# EAGLE schematic Full System (EAGLE 9.6.2)
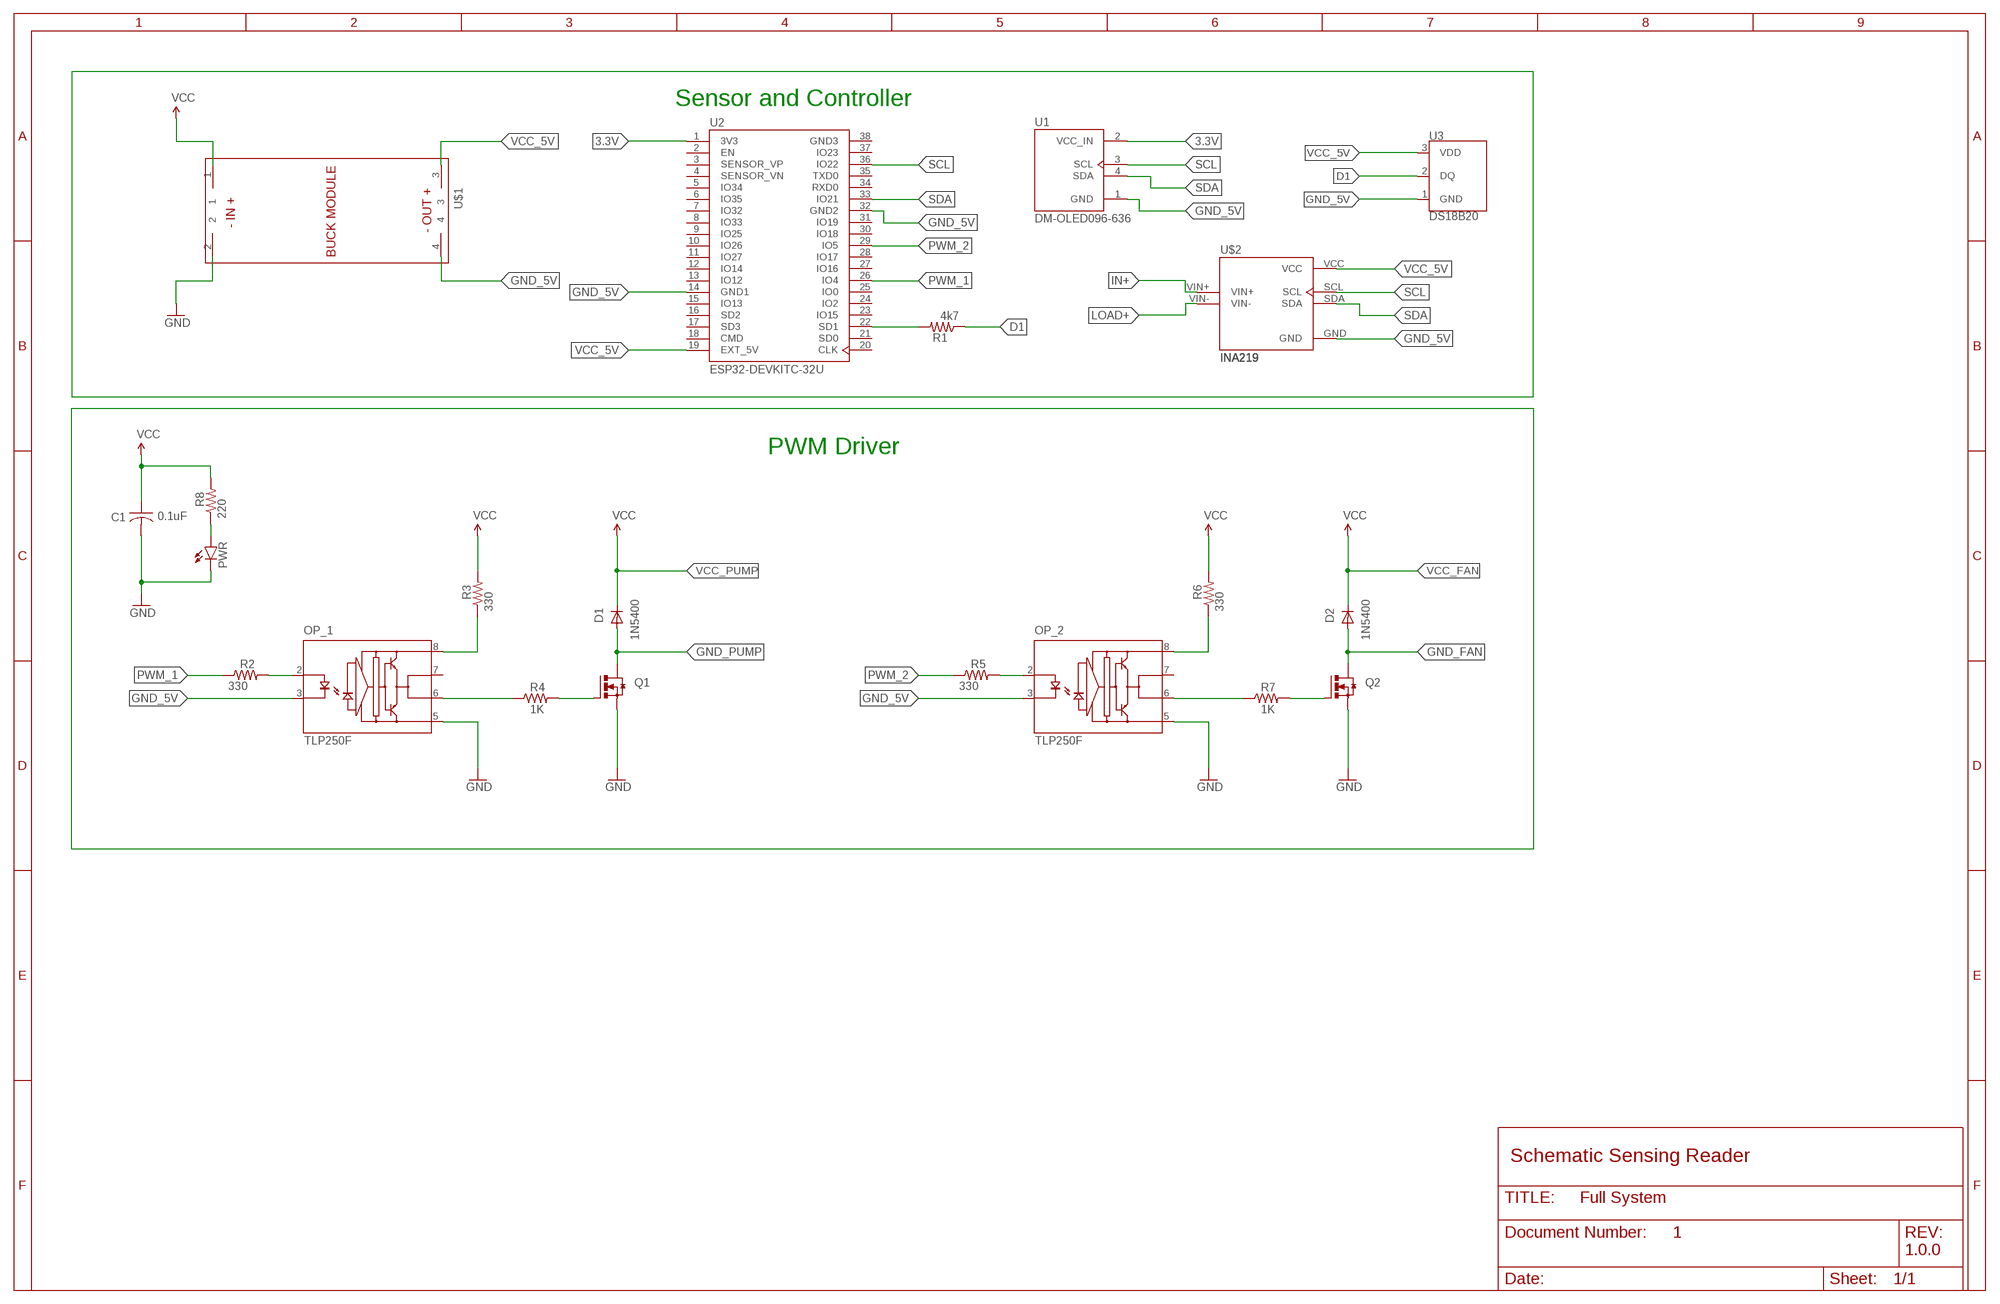
[diagram p0: schematic, sheet 1]
FRAME1 (FRAME_B_L): DESIGNER: PRATIK MAKWANA; DOC: 1; REV: 1.0.0

## Parts
C1  0.1uF  C-US050-030X075  [C050-030X075]
D1  1N5400  [DO201-15]
D2  1N5400  [DO201-15]
OP_1  TLP250F  [DIL08]
OP_2  TLP250F  [DIL08]
PWR  LED5MM  [LED5MM]
Q1  IRFP240  [TO247BV]
Q2  IRFP240  [TO247BV]
R1  4k7  R-US_0207/10  [0207/10]
R2  330  R-US_0207/10  [0207/10]
R3  330  R-US_0411/15  [0411/15]
R4  1K  R-US_0411/15  [0411/15]
R5  330  R-US_0207/10  [0207/10]
R6  330  R-US_0411/15  [0411/15]
R7  1K  R-US_0411/15  [0411/15]
R8  220  R-US_0207/10  [0207/10]
U1  DM-OLED096-636  [MODULE_DM-OLED096-636]
U2  ESP32-DEVKITC-32U  [MODULE_ESP32-DEVKITC-32U]
U3  DS18B20  [TO-92-AMMO]
U$1  BUCK_MODULEWITH_SMDPADS&THROUGHHOLES  [BUCK_MODULE]
U$2  INA219  [INA219]

## Nets
3.3V: U1.2(VCC_IN) U2.1(3V3)
D1: R1.1 U3.2(DQ)
GND: C1.2 OP_1.5(GND) OP_2.5(GND) PWR.K(C) Q1.S Q2.S U$1.2
GND_5V: OP_1.3(K) OP_2.3(K) U1.1(GND) U2.14(GND1) U2.32(GND2) U3.1(GND) U$1.4 U$2.GND
GND_FAN: D2.A Q2.D
GND_PUMP: D1.A Q1.D
IN+: U$2.VIN+
LOAD+: U$2.VIN-
N$1: R1.2 U2.22(SD1)
N$2: OP_1.2(A) R2.2
N$3: OP_2.2(A) R5.2
N$4: OP_1.6(VO) R4.1
N$5: Q1.G R4.2
N$6: OP_2.6(VO) R7.1
N$7: OP_1.8(VCC) R3.1
N$8: Q2.G R7.2
N$9: OP_2.8(VCC) R6.1
N$10: PWR.A R8.1
PWM_1: R2.1 U2.26(IO4)
PWM_2: R5.1 U2.29(IO5)
SCL: U1.3(SCL) U2.36(IO22) U$2.SCL
SDA: U1.4(SDA) U2.33(IO21) U$2.SDA
VCC: C1.1 R3.2 R8.2 U$1.1
VCC_5V: R6.2 U2.19(EXT_5V) U3.3(VDD) U$1.3 U$2.VCC ; supply symbol labelled VCC
VCC_FAN: D2.C ; supply symbol labelled VCC
VCC_PUMP: D1.C ; supply symbol labelled VCC
Unconnected: OP_1.7(VO') OP_2.7(VO') U2.2(EN) U2.3(SENSOR_VP) U2.4(SENSOR_VN) U2.5(IO34) U2.6(IO35) U2.7(IO32) U2.8(IO33) U2.9(IO25) U2.10(IO26) U2.11(IO27) U2.12(IO14) U2.13(IO12) U2.15(IO13) U2.16(SD2) U2.17(SD3) U2.18(CMD) U2.20(CLK) U2.21(SD0) U2.23(IO15) U2.24(IO2) U2.25(IO0) U2.27(IO16) U2.28(IO17) U2.30(IO18) U2.31(IO19) U2.34(RXD0) U2.35(TXD0) U2.37(IO23)

## Notes on the sheet
- Sensor and Controller
- PWM Driver
- Schematic Sensing Reader

## Power pins joined to a net without a drawn wire
GND3: U2.38(GND3)

## Library data of the parts
C1 = adafruit:C-US: CAPACITOR, American symbol
D1 D2 = diode:1N5400: DIODE standard rectifier, 3 A, 50 V (Motorola)
OP_1 OP_2 = optocoupler-3-jcn:TLP250F: Toshiba Transistor Inverter Inverter For Air Conditionor IGBT Gate Drive Power MOS FET Gate Drive
PWR = led:LED: LED OSRAM: - CHIPLED LG R971, LG N971, LY N971, LG Q971, LY Q971, LO R971, LY R971 LH N974, LH R974 LS Q976, LO Q976, LY Q976 LO Q996 - Hyper CHIPLED LW Q18S LB Q993, LB Q99A, LB R99A - SideLED LS A670, LO A670, LY A670, LG A670, LP A670 LB A673, LV A673, LT A673, LW A673 LH A674 LY A675 LS A676, LA A676, LO A676, LY A676, LW A676 LS A679, LY A679, LG A679 - Hyper Micro SIDELED® LS Y876, LA Y876, LO Y876, LY Y876 LT Y87S - SmartLED LW L88C, LW L88S LB L89C, LB L89S, LG L890 LS L89K, LO L89K, LY L89K LS L896, LA L896, LO L896, LY L896 - TOPLED LS T670, LO T670, LY T670, LG T670, LP T670 LSG T670, LSP T670, LSY T670, LOP T670, LYG T670 LG T671, LOG T671, LSG T671 LB T673, LV T673, LT T673, LW T673 LH T674 LS T676, LA T676, LO T676, LY T676, LB T676, LH T676, LSB T676, LW T676 LB T67C, LV T67C, LT T67C, LS T67K, LO T67K, LY T67K, LW E67C LS E67B, LA E67B, LO E67B, LY E67B, LB E67C, LV E67C, LT E67C LW T67C LS T679, LY T679, LG T679 LS T770, LO T770, LY T770, LG T770, LP T770 LB T773, LV T773, LT T773, LW T773 LH T774 LS E675, LA E675, LY E675, LS T675 LS T776, LA T776, LO T776, LY T776, LB T776 LHGB T686 LT T68C, LB T68C - Hyper Mini TOPLED® LB M676 - Mini TOPLED Santana® LG M470 LS M47K, LO M47K, LY M47K Source: http://www.osram.convergy.de LUXEON: - LUMILED® LXK2-PW12-R00, LXK2-PW12-S00, LXK2-PW14-U00, LXK2-PW14-V00 LXK2-PM12-R00, LXK2-PM12-S00, LXK2-PM14-U00 LXK2-PE12-Q00, LXK2-PE12-R00, LXK2-PE12-S00, LXK2-PE14-T00, LXK2-PE14-U00 LXK2-PB12-K00, LXK2-PB12-L00, LXK2-PB12-M00, LXK2-PB14-N00, LXK2-PB14-P00, LXK2-PB14-Q00 LXK2-PR12-L00, LXK2-PR12-M00, LXK2-PR14-Q00, LXK2-PR14-R00 LXK2-PD12-Q00, LXK2-PD12-R00, LXK2-PD12-S00 LXK2-PH12-R00, LXK2-PH12-S00 LXK2-PL12-P00, LXK2-PL12-Q00, LXK2-PL12-R00 Source: www.luxeon.com KINGBRIGHT: KA-3528ASYC Source: www.kingbright.com
Q1 Q2 = transistor-power:IRFP240: HEXFET Power MosFet Source: http://www.irf.com/
R1-R8 = adafruit:R-US_: RESISTOR, American symbol
U1 = DM-OLED096-636:DM-OLED096-636: Check availability <https://pricing.snapeda.com/parts/DM-OLED096-636/Display%20Module/view-part?ref=eda>; AVAILABILITY: Not in stock; CHECK_PRICES: https://www.snapeda.com/parts/DM-OLED096-636/Display+Module/view-part/?ref=eda; DESCRIPTION: 0.96” 128 X 64 MONOCHROME GRAPHIC OLED DISPLAY MODULE - I2C; MF: Display Module; MP: DM-OLED096-636; PACKAGE: Package; PRICE: None; SNAPEDA_LINK: https://www.snapeda.com/parts/DM-OLED096-636/Display+Module/view-part/?ref=snap
U2 = ESP32-DEVKITC-32U:ESP32-DEVKITC-32U: Check availability <https://pricing.snapeda.com/parts/ESP32-DEVKITC-32U/Espressif%20Systems/view-part?ref=eda>; AVAILABILITY: In Stock; CHECK_PRICES: https://www.snapeda.com/parts/ESP32-DEVKITC-32U/Espressif+Systems/view-part/?ref=eda; DESCRIPTION: ESP32-WROOM-32UE series Transceiver; 802.11 b/g/n (Wi-Fi, WiFi, WLAN), Bluetooth® Smart Ready 4.x Dual Mode Evaluation Board; MF: Espressif Systems; MP: ESP32-DEVKITC-32U; PACKAGE: CUSTOM-38 ESPRESSIF; PRICE: None; SNAPEDA_LINK: https://www.snapeda.com/parts/ESP32-DEVKITC-32U/Espressif+Systems/view-part/?ref=snap
U3 = DS18B20:DS18B20: Dallas/Maxim DS18B20 1-Wire Temperature Sensor The DS18B20 reports degrees C with 9 to 12-bit precision, -55C to 125C (+/-0.5C). Each sensor has a unique 64-Bit Serial number etched into it - allows for a huge number of sensors to be used on one data bus. Datasheet <http://datasheets.maximintegrated.com/en/ds/DS18B20.pdf> SparkFun Products One Wire Digital Temperature Sensor - DS18B20 <https://www.sparkfun.com/products/245> (SEN-00245) Check availability <https://pricing.snapeda.com/parts/DS18B20/UMW/view-part?ref=eda>; AVAILABILITY: In Stock; CHECK_PRICES: https://www.snapeda.com/parts/DS18B20/UMW/view-part/?ref=eda; DESCRIPTION: Temperature Sensor Digital, Local -55°C ~ 125°C 9 b, 10 b, 11 b, 12 b TO-92; MF: UMW; MP: DS18B20; PACKAGE: None; PRICE: None; SNAPEDA_LINK: https://www.snapeda.com/parts/DS18B20/UMW/view-part/?ref=snap
U$1 = BUCK_MODULE:BUCK_MODULE
U$2 = INA219:INA219